# Altium project Receiver.PrjPcb
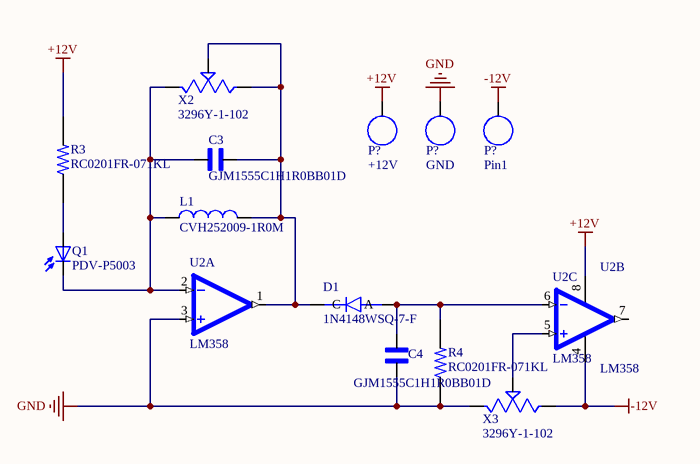
[diagram p0: uni project 1 RECEIVER.SchDoc]
1 sheet, 13 parts. Net scope: global (net labels, ports and power ports of the same name join across sheets).
Board file: PCB1.PcbDoc

## Sheet uni project 1 RECEIVER.SchDoc
size A4; SheetNumber: 1; SheetTotal: 1

### Parts
+12  +12V  [Pin1]
-12  Pin1  [Pin1]
C3  GJM1555C1H1R0BB01D  [CAPC1005X55N]
C4  GJM1555C1H1R0BB01D  [CAPC1005X55N]
D1  1N4148WSQ-7-F  [SOD2513X120N]
GND  GND  [Pin1]
L1  CVH252009-1R0M  [INDC2520X100N]
Q1  PDV-P5003  [XDCR_PDV-P8003]
R3  RC0201FR-071KL  [RESC0603X26N]
R4  RC0201FR-071KL  [RESC0603X26N]
U2  LM358  [SO8]  (parts A,B,C of 3)
X2  3296Y-1-102  [TRIM_3296Y-1-102]
X3  3296Y-1-102  [TRIM_3296Y-1-102]

### Nets
+12V: +12.0 R3.2 U2.8(V+)
-12V: -12.0 U2.4(V-) X3.3(CW)
GND: C4.1 GND.0 R4.1 U2.3(+IN) X3.1(CCW)
NetC3_1: C3.1 L1.1 Q1.C U2.2(-IN) X2.1(CCW)
NetC3_2: C3.2 D1.C L1.2 U2.1(OUT) X2.2(WIPER) X2.3(CW)
NetC4_2: C4.2 D1.A R4.2 U2.6(-IN)
NetQ1_A: Q1.A R3.1
NetU2_5: U2.5(+IN) X3.2(WIPER)

Not connected (* = marked no-connect by the designer): U2 7(OUT)

### Library data of the parts
+12 GND = Pin1
C3 C4 = GJM1555C1H1R0BB01D: 0402 1 pF 50 V Â±0.1 pF Tolerance C0G SMT Multilayer Ceramic Capacitor; MF: Murata; SnapEDA_Link: https://www.snapeda.com/parts/GJM1555C1H1R0BB01D/Murata/view-part/?ref=snap; Package: 1005 Taiyo Yuden; Value: *; MP: GJM1555C1H1R0BB01D; Check_prices: https://www.snapeda.com/parts/GJM1555C1H1R0BB01D/Murata/view-part/?ref=eda
D1 = 1N4148WSQ-7-F: Diode Standard 75 V 150mA Surface Mount SOD-323; MF: Diodes Inc.; SnapEDA_Link: https://www.snapeda.com/parts/1N4148WSQ-7-F/Diodes+Inc./view-part/?ref=snap; Package: SOD-323 Diodes Inc.; Value: *; MP: 1N4148WSQ-7-F; Check_prices: https://www.snapeda.com/parts/1N4148WSQ-7-F/Diodes+Inc./view-part/?ref=eda
L1 = CVH252009-1R0M: 1 µH Shielded Multilayer Inductor 1.6 A 55mOhm Max 1008 (2520 Metric); MF: Bourns; Package: 1008 Bourns; Availability: In Stock; Value: *; MP: CVH252009-1R0M; Purchase-URL: https://pricing.snapeda.com/search/part/CVH252009-1R0M/?ref=eda; Check_prices: https://www.snapeda.com/parts/CVH252009-1R0M/Bourns/view-part/?ref=eda; Price: None; SnapEDA_Link: https://www.snapeda.com/parts/CVH252009-1R0M/Bourns/view-part/?ref=snap
Q1 = PDV-P5003: CDS Cells 520nm 12 ~ 58kOhms @ 10 lux; MF: Vishay; MP: TLLR4400; SnapEDA_Link: https://www.snapeda.com/parts/TLLR4400/Vishay+Semiconductor+Opto+Division/view-part/?ref=snap; Package: None; Value: *; Check_prices: https://www.snapeda.com/parts/TLLR4400/Vishay+Semiconductor+Opto+Division/view-part/?ref=eda
R3 R4 = RC0201FR-071KL: 1 kOhms Â±1% 0.05W, 1/20W Chip Resistor 0201 (0603 Metric) Moisture Resistant Thick Film; MF: Yageo; SnapEDA_Link: https://www.snapeda.com/parts/RC0201FR-071KL/Yageo/view-part/?ref=snap; Package: 0201 Yageo; Value: *; MP: RC0201FR-071KL; Check_prices: https://www.snapeda.com/parts/RC0201FR-071KL/Yageo/view-part/?ref=eda
U2 = LM358: MF: UTC; SnapEDA_Link: https://www.snapeda.com/parts/LM358/UTC/view-part/?ref=snap; Package: None; Value: *; MP: LM358; Check_prices: https://www.snapeda.com/parts/LM358/UTC/view-part/?ref=eda
X2 X3 = 3296Y-1-102: MP: 3296Y-1-102; Package: None; Price: None; Availability: Unavailable; Value: *